# Altium schematic sheet 06_CAN_RS485.SchDoc
size A4; SheetNumber: 6; SheetTotal: 12
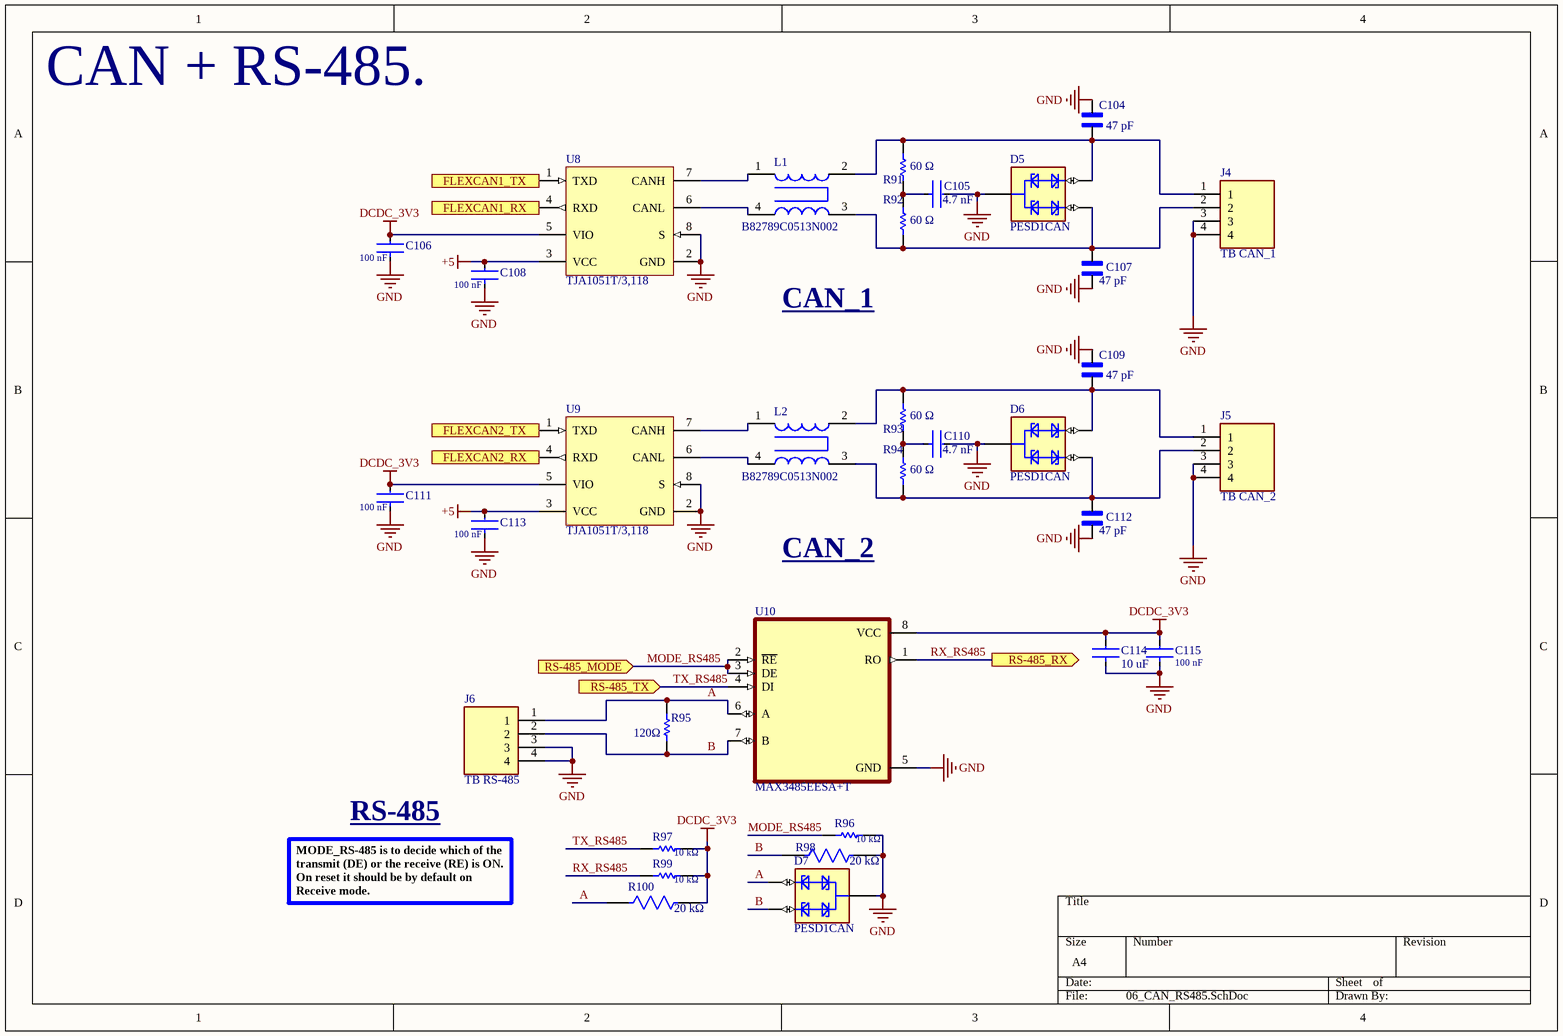
[diagram p0: 06_CAN_RS485.SchDoc]

## Parts
C104  47 pF  [CAPC1608X90]
C105  4.7 nF  [FP-CC0603-DA-MFG]
C106  100 nF  [FP-CC0603-DA-MFG]
C107  47 pF  [CAPC1608X90]
C108  100 nF  [FP-CC0603-DA-MFG]
C109  47 pF  [CAPC1608X90]
C110  4.7 nF  [FP-CC0603-DA-MFG]
C111  100 nF  [FP-CC0603-DA-MFG]
C112  47 pF  [CAPC1608X90]
C113  100 nF  [FP-CC0603-DA-MFG]
C114  10 uF  [FP-GRM188-0_2-IPC_B]
C115  100 nF  [FP-CC0603-DA-MFG]
D5  PESD1CAN  [SOT23-3]
D6  PESD1CAN  [SOT23-3]
D7  PESD1CAN  [SOT23-3]
J4  TB CAN_1  [TE_282834-4]
J5  TB CAN_2  [TE_282834-4]
J6  TB RS-485  [TE_282834-4]
L1  B82789C0513N002  [FP-B82789C0513N002-0]
L2  B82789C0513N002  [FP-B82789C0513N002-0]
R91  60 Ω  [RESC1608X55X25ML10T15]
R92  60 Ω  [RESC1608X55X25ML10T15]
R93  60 Ω  [RESC1608X55X25ML10T15]
R94  60 Ω  [RESC1608X55X25ML10T15]
R95  120Ω  [RESC1608X55X25ML10T15]
R96  10 kΩ  [RESC1608X55X25ML10T15]
R97  10 kΩ  [RESC1608X55X25ML10T15]
R98  20 kΩ  [FP-RT0603-MFG]
R99  10 kΩ  [RESC1608X55X25ML10T15]
R100  20 kΩ  [FP-RT0603-MFG]
U8  TJA1051T/3,118  [NXP-SOIC-8_L]
U9  TJA1051T/3,118  [NXP-SOIC-8_L]
U10  MAX3485EESA+T  [SOIC127P600X175-8N]

## Ports
FLEXCAN1_RX (out), FLEXCAN1_TX (in), FLEXCAN2_RX (out), FLEXCAN2_TX (in), RS-485_MODE (in), RS-485_RX (out), RS-485_TX (in)

## Nets
+5: C108.2 C113.2 U8.3(VCC) U9.3(VCC)
DCDC_3V3: C106.2 C111.2 C114.2 C115.2 R97.1 R99.1 R100.2 U8.5(VIO) U9.5(VIO) U10.8(VCC)
GND: C104.1 C105.2 C106.1 C107.2 C108.1 C109.1 C110.2 C111.1 C112.2 C113.1 C114.1 C115.1 D5.3 D6.3 D7.3 J4.3 J4.4 J5.3 J5.4 J6.3 J6.4 R96.1 R98.2 U8.2(GND) U8.8(S) U9.2(GND) U9.8(S) U10.5(GND)
A: D7.2 J6.1 R95.2 R100.1 U10.6(A)
B: D7.1 J6.2 R95.1 R98.1 U10.7(B)
FLEXCAN1_RX: U8.4(RXD) ; port FLEXCAN1_RX
FLEXCAN1_TX: U8.1(TXD) ; port FLEXCAN1_TX
FLEXCAN2_RX: U9.4(RXD) ; port FLEXCAN2_RX
FLEXCAN2_TX: U9.1(TXD) ; port FLEXCAN2_TX
MODE_RS485: R96.2 U10.2(~{RE}) U10.3(DE) ; port RS-485_MODE
RX_RS485: R99.2 U10.1(RO) ; port RS-485_RX
TX_RS485: R97.2 U10.4(DI) ; port RS-485_TX
NetC104_2: C104.2 D5.1 J4.1 L1.2 R91.2
NetC105_1: C105.1 R91.1 R92.2
NetC107_1: C107.1 D5.2 J4.2 L1.3 R92.1
NetC109_2: C109.2 D6.1 J5.1 L2.2 R93.2
NetC110_1: C110.1 R93.1 R94.2
NetC112_1: C112.1 D6.2 J5.2 L2.3 R94.1
NetL1_1: L1.1 U8.7(CANH)
NetL1_4: L1.4 U8.6(CANL)
NetL2_1: L2.1 U9.7(CANH)
NetL2_4: L2.4 U9.6(CANL)

## Notes on the sheet
- CAN + RS-485.
- CAN_1
- CAN_2
- RS-485
- MODE_RS-485 is to decide which of the transmit (DE) or the receive (RE) is ON.
  On reset it should be by default on Receive mode.

## Library data of the parts
C104 C107 C109 C112 = CC0603JRNPO9BN470: 47 pF Â±5% 50V Ceramic Capacitor C0G, NP0 0603 (1608 Metric); MF: Yageo; SnapEDA_Link: https://www.snapeda.com/parts/CC0603JRNPO9BN470/Yageo/view-part/?ref=snap; Package: 0603 Yageo; Value: *; MP: CC0603JRNPO9BN470; Check_prices: https://www.snapeda.com/parts/CC0603JRNPO9BN470/Yageo/view-part/?ref=eda
C105 C110 = CMP-2100-03603-2: CAP CER 4700PF 50V X7R 0603; Manufacturer Part Number: CC0603KRX7R9BB472; Manufacturer: YAGEO; Tolerance: 0.1; Temperature Coefficient: 15%; Material: Ceramic; Value: 4.7 nF; Category: Cap; Automotive: No; Package: CC0603-DA; Temperature Characteristic: X7R; Lead Free: Yes; Capacitance: 4.7 nF; Footprint Url: http://www.yageo.com/exep/pages/download/literatures/UPY-C_GEN_24.pdf; Voltage: 50 V; Device Class L2: Capacitors; Temperature Range Low: -55°C; Octopart: https://octopart.com/cc0603krx7r9bb472-yageo-192936; Temperature Range High: +125°C; Temperature: -55°C to +125°C; Device Class L1: Passive Components; Height: 0.9mm; Mouser Description: Multilayer Ceramic Capacitors MLCC - SMD/SMT 4700PF 50V 10% 0603; ComponentLink2URL: http://www.yageo.com/documents/recent/UPY-GPHC_X7R_6.3V-to-50V_18.pdf; Digikey Description: CAP CER 4700PF 50V X7R 0603; ComponentLink2Description: Datasheet; RoHS: TRUE; Voltage Rating: 50 V; Device Class L3: Ceramic Capacitors
C106 C108 C111 C113 C115 = CMP-2100-03601-2: CAP CER 0.1UF 50V X7R 0603; Manufacturer: YAGEO; Manufacturer Part Number: CC0603KRX7R9BB104; Material: Ceramic; Temperature Coefficient: 15%; Tolerance: 0.1; Height: 0.9mm; Voltage: 50 V; ComponentLink2Description: Datasheet; Device Class L2: Capacitors; Temperature Range High: +125°C; Category: Cap; Capacitance: 100 nF; Footprint Url: http://www.yageo.com/exep/pages/download/literatures/UPY-C_GEN_24.pdf; ComponentLink2URL: http://www.yageo.com/documents/recent/UPY-GPHC_X7R_6.3V-to-50V_18.pdf; Package: CC0603-DA; Temperature: -55°C to +125°C; Voltage Rating: 50 V; Temperature Characteristic: X7R; Device Class L1: Passive Components; Temperature Range Low: -55°C; RoHS: TRUE; Automotive: No; Value: 100 nF; Device Class L3: Ceramic Capacitors; Octopart: https://octopart.com/cc0603krx7r9bb104-yageo-42244635; Mouser Description: Multilayer Ceramic Capacitor, CC Series, 0.1 - F, - 10%, X7R, 50 V, 0603 [1608 Metric]; Lead Free: Yes; Digikey Description: CAP CER 0.1UF 50V X7R 0603
C114 = CMP-06035-036920-1: Chip Multilayer Ceramic Capacitors for General Purpose, 0603, 10uF, X7R, 15%, 20%, 10V; Case/Package: 0603
D5-D7 = PESD1CAN: 50V Clamp 3A (8/20Âµs) Ipp Tvs Diode Surface Mount SOT-323; MF: Nexperia USA; SnapEDA_Link: https://www.snapeda.com/parts/PESD1CAN/Nexperia/view-part/?ref=snap; Package: SOT-23-3 NXP Semiconductors; Value: *; MP: PESD1CAN; Check_prices: https://www.snapeda.com/parts/PESD1CAN/Nexperia/view-part/?ref=eda
J4-J6 = 282834-4: Conn; Term Blk; PCB; Wire Receptacle; 4; 2.54mm; 30-16AWG; Green; 10A;150V; M1.6 | TE Connectivity 282834-4; Number_of_Positions: 4; Centerline_Pitch: 2.54 mm[.1 in]; SnapEDA_Link: https://www.snapeda.com/parts/282834-4/TE+Connectivity+AMP+Connectors/view-part/?ref=snap; Package: None; Value: *; MF: TE Connectivity; MP: 282834-4; EU_RoHS_Compliance: Compliant with Exemptions; Check_prices: https://www.snapeda.com/parts/282834-4/TE+Connectivity+AMP+Connectors/view-part/?ref=eda
L1 L2 = CMP-10467-000006-1: CMC 51UH 250MA 2LN SMD AEC-Q200; Test Frequency: 50Hz; Tolerance: 50%; Shielding: Unshielded; DC Resistance (DCR): 550mR; Core Material: Ferrite; Packaging: Tape and Reel; Length: 4.5mm; Max Operating Temperature: 125°C; RoHS Compliant: Yes; Height: 3mm; Max DC Current: 250mA; Package Quantity: 2500; Termination: SMD/SMT; Min Operating Temperature: -55°C; Case/Package: 1812; Inductance: 51uH; Military Standard: Not; DC Current: 250mA; Weight: 0.000952oz; Series: B82789C0/S0; Depth: 3.5mm; Width: 3.2mm
R91-R94 = CMP-2000-04100-1: Part Number: RC0603FR-0760R4L; Manufacturer: Yageo
R95 = CMP-1659-00034-1: Chip Resistor, 120 Ohm, +/- 1%, 100 mW, -55 to 155 degC, 0603 (1608 Metric), RoHS, Tape and Reel; Nominal Vf: 2.1 V; Power Rating: 90 mW; Case\Package: 0603; Lens Style: Diffused; Viewing Angle: 160 degrees; Forward Current: 20 mA; Luminous Intensity: 80 mcd; Illumination Colour: Orange; Nominal Wavelength: 606 nm; Package Quantity: 3000; Radiation Hardening: No; ComponentLink2URL: http://www.yageo.com/documents/recent/PYu-RC_Group_51_RoHS_L_04.pdf; Mount: Surface Mount; ComponentLink1URL: http://www.yageo.com/; PackageReference: 0603; PackageDescription: 2-Pin Surface Mount Device, Body 1.6 x 0.8 mm; Min Operating Temperature: -40 degC; Colour: Orange; Case Code (Metric): 1608; Length: 1.6 mm; Width: 0.8 mm; Packaging: Tape and Reel; Case Code (Imperial): 0603; RoHSCompliant: true; Height: 0.6 mm; DatasheetVersion: Rev. 4, 02/2016; Pins: 2; ComponentLink1Description: Manufacturer URL; Forward Voltage: 2.1 V; Max Operating Temperature: 100 degC; REACH SVHC: Unknown; ComponentLink2Description: Datasheet
R96 R97 R99 = CMP-2000-05022-1: Resistor, 10 KOhm, +/- 5%, 100 mW, -55 to 155 degC, 0603 (1608 Metric), RoHS, Tape and Reel; Manufacturer: Yageo; Resistance: 10kOhms; Voltage Rating: 50V; Temperature Coefficient: 100PPM/C; Power Rating: 100mW; Package Reference: 603; Series: RC; Case Code - mm: 1608; Packaging: Reel; Datasheet URL: http://www.farnell.com/datasheets/443971.pdf; Datasheet Version: Rev. 4, 04/2009; Operating Temperature Range: -55Cto+155C; Product: ThickFilmResistorsGeneralPurpose; Package Description: 2-Pin Surface Mount Device, Body 1.6 x 0.8 mm; Manufacturer URL: http://www.yageo.com/; Case Code - in: 0603; Tolerance: 5%; Termination Style: SMD/SMT
R98 R100 = CMP-2000-04684-2: RES SMD 20K OHM 1% 1/10W 0603; Manufacturer Part Number: RT0603FRE0720KL; Manufacturer: Yageo; Power Rating: 0.1W; Value: 20KΩ; Voltage Rating: 75V; Temperature Coefficient: 50 ppm/°C; Tolerance: 0.01; Lead Free: Yes; Ipc Land Pattern Name: RESC16080X45; Device Class L1: Passive Components; Category: Res; Composition: Thin Film; Temperature Range Low: -55°C; Temperature: -55°C to +155°C; ComponentLink2URL: http://www.yageo.com/documents/recent/PYu-RT_1-to-0.01_RoHS_L_9.pdf; Resistance: 20KΩ; Temperature Range High: +155°C; Digikey Description: RES SMD 20K OHM 1% 1/10W 0603; Automotive: No; Device Class L3: Chip SMD Resistors; ComponentLink2Description: Datasheet; RoHS: TRUE; Series: RT; Footprint Url: http://www.yageo.com/exep/pages/download/literatures/PYu-R_Mount_10.pdf; Octopart: https://octopart.com/rt0603fre0720kl-yageo-1365335; Mouser Description: High Precision-High Stability Chip Resistor Thin Film 0603 20kOhm 1% Paper T/R; Height: 0.55mm; Package: RT0603; Device Class L2: Resistors
U8 U9 = CMP-2000-07245-1: High-Speed CAN Transceiver, 3 to 5 V, 8-Pin SOIC (SOT96-1), RoHS, Tape and Reel; Manufacturer: NXP; Power Down Mode: Normal/Silent; Rad Hardened: No; Number of Transceivers: 1; Supply Current: 70mA; Operating Supply Voltage (Max): 5.5V; Operating Supply Voltage (Typ): 5V; Operating Supply Voltage (Min): 4.5V; Standard Supported: ISO11898-2; Data Rate: 1Mbps; DELETED: Compliant; Operating Temperature (Min): -40C; Datasheet Version: Rev. 7, 01/2015; Pin Count: 8; Operating Temperature (Max): 125C; Package Description: 8-Pin Small Outline Integrated Circuit, Body 4.9 x 3.9 mm, Pitch 1.27 mm; Category: Transceiver; Packaging: TapeandReel; Mounting: SurfaceMount; Package Reference: SOT96-1; Operating Temperature Classification: Automotive; Mounting Technology: SurfaceMount; Package Type: SO; Manufacturer URL: http://www.nxp.com/; Datasheet URL: http://www.nxp.com/documents/data_sheet/TJA1051.pdf
U10 = MAX3485EESA+T: 3.3V Powered, Â±15kV ESD-Protected, 12Mbps, Slew-Rate-Limited True RS-485/RS-422 Transceivers3.3V ä¾›ç”µã€Â±15kV ESD ä¿æŠ¤ã€12Mbpsã€åŽ‹æ‘†çŽ‡å—é™çš„çœŸæ­£ RS-485/RS-422 æ”¶å‘å™¨; MF: Analog Devices; SnapEDA_Link: https://www.snapeda.com/parts/MAX3485EESA+T/Analog+Devices/view-part/?ref=snap; Package: SOIC-8 Maxim; Value: *; MP: MAX3485EESA+T; Check_prices: https://www.snapeda.com/parts/MAX3485EESA+T/Analog+Devices/view-part/?ref=eda